# Altium schematic sheet 4.Power Source.SchDoc
size A4; DocumentNumber: 4; SheetNumber: 4
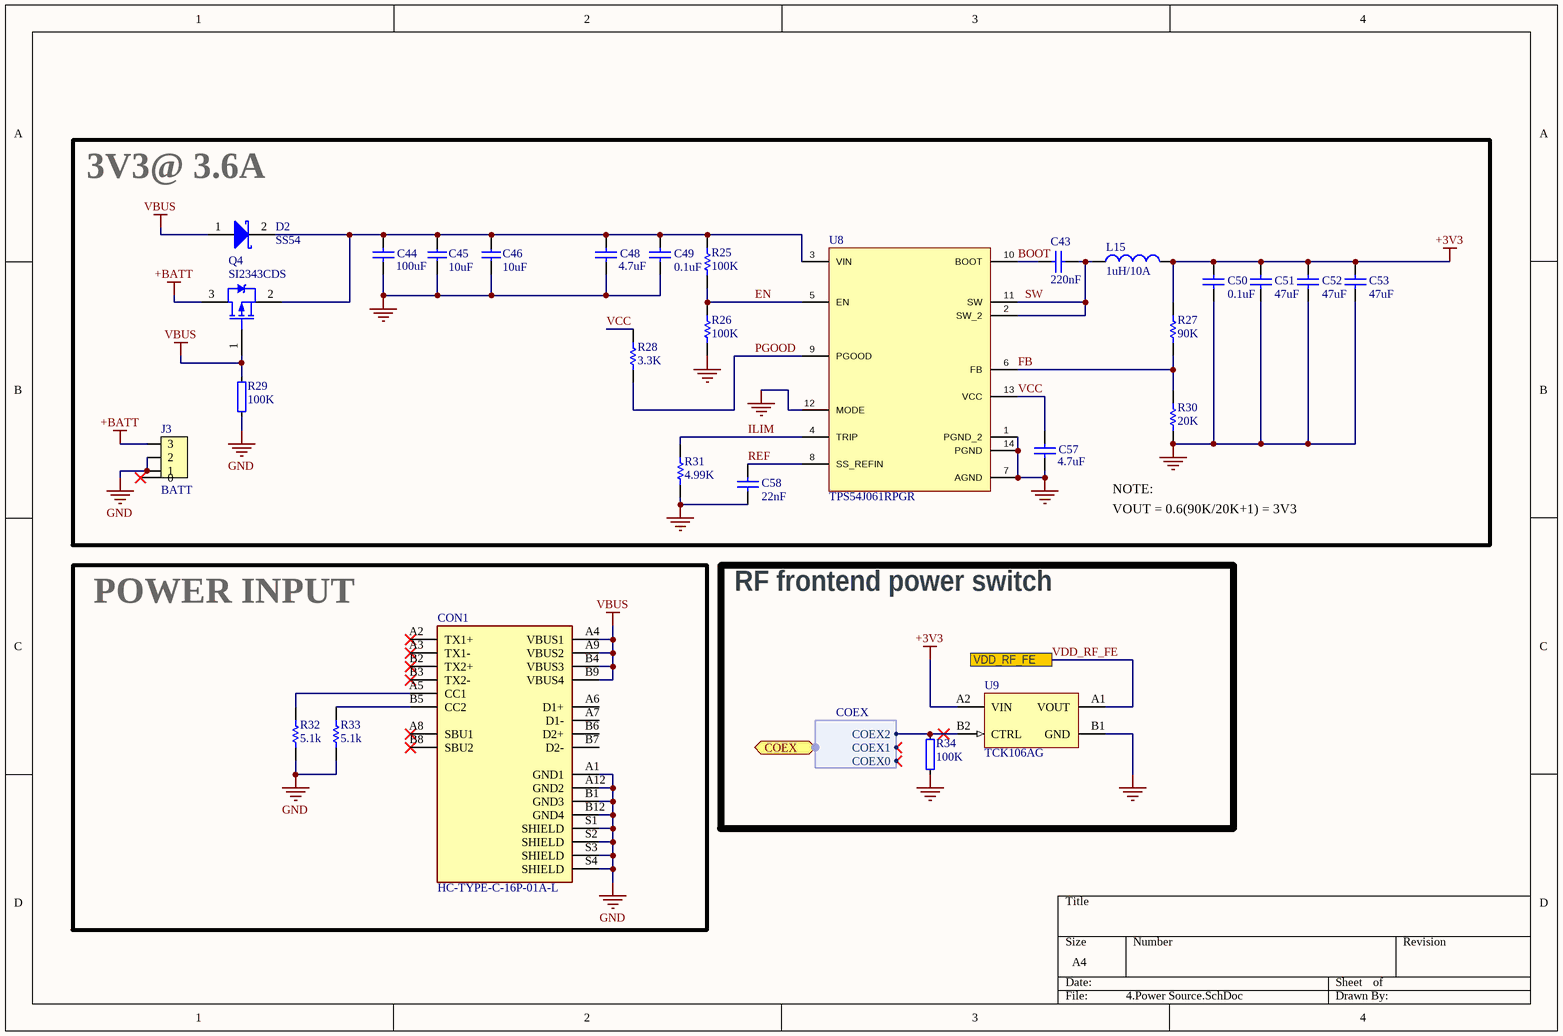
[diagram p0: 4.Power Source.SchDoc]

## Parts
C43  220nF  [CAPC1608X06L_3]
C44  100uF  [CAPC3225CX04L]
C45  10uF  [CAPC1608X06L_3]
C46  10uF  [CAPC1608X06L_3]
C48  4.7uF  [CAPC1608X06L_3]
C49  0.1uF  [CAPC1608X06L_3]
C50  0.1uF  [CAPC1608X06L_3]
C51  47uF  [CAPC2012X11L]
C52  47uF  [CAPC2012X11L]
C53  47uF  [CAPC2012X11L]
C57  4.7uF  [CAPC1608X06L_3]
C58  22nF  [CAPC1608X06L_3]
CON1  HC-TYPE-C-16P-01A-L  [CONN_RCP_USB3.1_TYPE-C_16P_SMD_BLUE-HC-TYPE-C-16P-01A-L]
D2  SS54  [DO-214AC(SMA)]
J3  BATT  [CONN_SMD_3P_1mm_SM03B-SRSS-TB]
L15  1uH/10A  [IND_SMD_5.5X5.9MM]
Q4  SI2343CDS  [SOT-23a]
R25  100K  [RESC1608X03L_C_2]
R26  100K  [RESC1608X03L_C_2]
R27  90K  [RESC2012X11L]
R28  3.3K  [RESC1608X03L_C_2]
R29  100K  [RESC1005X04L]
R30  20K  [RESC2012X11L]
R31  4.99K  [RESC1608X03L_C_2]
R32  5.1k  [RESC1608X03L_C_2]
R33  5.1k  [RESC1608X03L_C_2]
R34  100K  [RESC1005X04L]
U8  TPS54J061RPGR  [VQFN-14_2MMX3MM]
U9  TCK106AG  [BGA4C40P2X2_76X76X62]

## Blocks framed on the sheet
3V3@ 3.6A: C43-C46 C48-C53 C57 C58 D2 J3 L15 Q4 R25-R31 U8
POWER INPUT: CON1 R32 R33
RF frontend power switch: R34 U9

## Ports
COEX (bidir, harness COEX), VDD_RF_FE

## Harnesses
COEX: COEX2, COEX1, COEX0

## Nets
+3V3: C50.2 C51.2 C52.2 C53.2 L15.2 R27.2 U9.A2(VIN)
+BATT: J3.3 Q4.3(D)
GND: C44.1 C45.2 C46.2 C48.1 C49.1 C50.1 C51.1 C52.1 C53.1 C57.1 C58.1 CON1.A1(GND1) CON1.A12(GND2) CON1.B1(GND3) CON1.B12(GND4) CON1.S1(SHIELD) CON1.S2(SHIELD) CON1.S3(SHIELD) CON1.S4(SHIELD) J3.1 J3.2 R26.1 R29.1 R30.1 R31.1 R32.2 R33.2 R34.1 U8.1(PGND_2) U8.7(AGND) U8.12(MODE) U8.14(PGND) U9.B1(GND)
VBUS: CON1.A4(VBUS1) CON1.A9(VBUS2) CON1.B4(VBUS3) CON1.B9(VBUS4) D2.1(A) Q4.1(G) R29.2
BOOT: C43.1 U8.10(BOOT)
EN: R25.1 R26.2 U8.5(EN)
FB: R27.1 R30.2 U8.6(FB)
ILIM: R31.2 U8.4(TRIP)
PGOOD: R28.1 U8.9(PGOOD)
REF: C58.2 U8.8(SS_REFIN)
SW: C43.2 L15.1 U8.2(SW_2) U8.11(SW)
VCC: C57.2 R28.2 U8.13(VCC)
VDD_RF_FE: U9.A1(VOUT) ; port VDD_RF_FE
NetC44_2: C44.2 C45.1 C46.1 C48.2 C49.2 D2.2(K) Q4.2(S) R25.2 U8.3(VIN)
NetCON1_A5: CON1.A5(CC1) R32.1
NetCON1_B5: CON1.B5(CC2) R33.1
NetR34_2: R34.2 U9.B2(CTRL) ; port COEX.COEX2

Not connected (* = marked no-connect by the designer): CON1 A2(TX1+)* A3(TX1-)* A6(D1+) A7(D1-) A8(SBU1)* B2(TX2+)* B3(TX2-)* B6(D2+) B7(D2-) B8(SBU2)*; J3 0*

## Notes on the sheet
- NOTE:
- VOUT = 0.6(90K/20K+1) = 3V3

## Library data of the parts
C43 C44 C48-C53 C57 C58 = Cap: Capacitor
  C43: LCSC: C21120; Package: 0603
  C44: LCSC: C394395; Package: 1210
  C48 C57: LCSC: C109456; Package: 0603
  C49 C50: LCSC: C129621; Package: 0603
  C51-C53: LCSC: C16780; Package: 0805
  C58: LCSC: C21122; Package: 0603
C45 C46 = C0201-15p: Capacitor, NP0, ±5%, 25V; ComponentLink1URL: N.A.; ComponentLink1Description: Datasheet; ComponentLink2URL: N.A.; ComponentLink2Description: Supplier link; Package: 0603; LCSC: C386081
CON1 = HC-TYPE-C-16P-01A-L: 3A USB 3.1 1 260℃ Surface Mount 16 Female -40℃~+85℃ Gold plating High Conductivity Copper Type-C SMD USB Connectors ROHS; LCSC: C2997432
D2 = D Schottky: Schottky Diode; LCSC: C22452
J3 = SM03B-SRSS-TB: 1.0mm pitch connector side entry SMD; ComponentLink1URL: N.A.; ComponentLink1Description: Datasheet; ComponentLink2URL: N.A.; ComponentLink2Description: Supplier link; LCSC: C160403
L15 = Inductor: 3.3A 3.3uH ±20% 3.3A SMD,5.2x5.8x4.5mm Power Inductors ROHS /; Footprint: SMD,5.5x5.9mm; LCSC: C2903681
Q4 = PMOS-2: P-Channel Power MOSFET; LCSC: C6903; ComponentLink1Description: Manufacturer Link; ComponentLink1URL: http://www.irf.com/
R25-R28 R30-R33 = Res1: Resistor
  R25 R26: LCSC: C103211; Package: 0603
  R27: LCSC: C5123603; Package: 0805
  R28: LCSC: C22978; Package: 0603
  R30: LCSC: C4328; Package: 0805
  R31: LCSC: C23046; Package: 0603
  R32 R33: LCSC: C144111
R29 R34 = R0201-10k: Resistor, ±1%, 0.05W; ComponentLink1URL: N.A.; ComponentLink1Description: Datasheet; ComponentLink2URL: N.A.; ComponentLink2Description: Supplier link; LCSC: C25741; Package: 0402
U9 = TCK106AG: 1.0 A Load Switch IC with Slew Rate Control Driver in Ultra Small Package; Manufacturer: Toshiba; Manufacturer Part Number: TCK106AG,LF; Part number IPS: 00000004390; Pad Count: 4; Note: N.A.; Part Number: TCK106AG; PartId: 101900575; Component Class: Misc_ICs; ComponentLink1URL: https://toshiba.semicon-storage.com/info/docget.jsp?did=30131&prodName=TCK106AG; ComponentLink1Description: Datasheet; ComponentLink2URL: N.A.; ComponentLink2Description: Supplier link; HelpURL: N.A.; Footprint Doc: WLCSP-4; LatestRevisionDate: 2019-03-01; Published: 2019-02-17; Value: TCK106AG; Supplier 1: Digi-Key; Supplier Part Number 1: TCK106AGLFTR-ND; Supplier 2: Mouser; Supplier Part Number 2: 757-TCK106AGLF; Artikkelnr Noca: N.A.; LCSC: C146305
U8 = TPS54J061RPGR: LCSC: C2873462